# Altium schematic sheet TOP_SHEET.SchDoc
size A; SheetNumber: 1; SheetTotal: 9
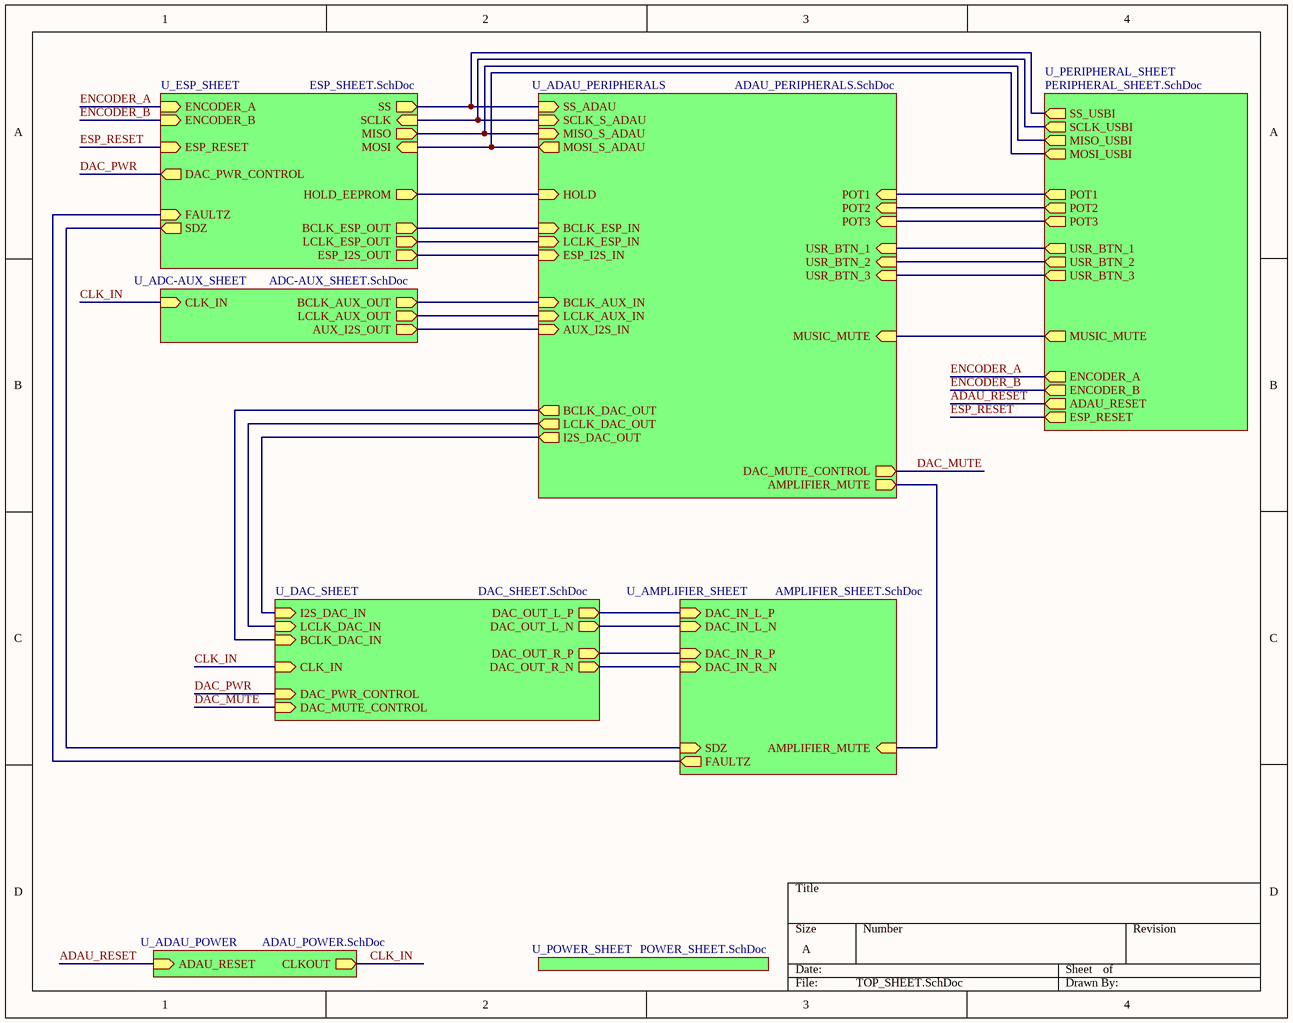
[diagram p0: TOP_SHEET.SchDoc]

## Sub-sheets
U_ADAU_PERIPHERALS = ADAU_PERIPHERALS.SchDoc: BCLK_DAC_OUT (out), LCLK_DAC_OUT (out), I2S_DAC_OUT (out), USR_BTN_3 (in), USR_BTN_2 (in), USR_BTN_1 (in), POT3 (in), POT2 (in), POT1 (in), SS_ADAU (in), SCLK_S_ADAU (in), MISO_S_ADAU (in), MOSI_S_ADAU (out), HOLD (in), BCLK_ESP_IN (in), LCLK_ESP_IN (in), ESP_I2S_IN (in), LCLK_AUX_IN (in), BCLK_AUX_IN (in), AUX_I2S_IN (in), AMPLIFIER_MUTE (out), DAC_MUTE_CONTROL (out), MUSIC_MUTE (in)
U_ADAU_POWER = ADAU_POWER.SchDoc: ADAU_RESET (in), CLKOUT (out)
U_ADC-AUX_SHEET = ADC-AUX_SHEET.SchDoc: BCLK_AUX_OUT (out), LCLK_AUX_OUT (out), AUX_I2S_OUT (out), CLK_IN (in)
U_AMPLIFIER_SHEET = AMPLIFIER_SHEET.SchDoc: DAC_IN_R_P (in), DAC_IN_R_N (in), DAC_IN_L_P (in), DAC_IN_L_N (in), SDZ (in), AMPLIFIER_MUTE (in), FAULTZ (out)
U_DAC_SHEET = DAC_SHEET.SchDoc: DAC_OUT_L_P (out), DAC_OUT_L_N (out), DAC_PWR_CONTROL (in), DAC_MUTE_CONTROL (in), CLK_IN (in), I2S_DAC_IN (in), BCLK_DAC_IN (in), LCLK_DAC_IN (in), DAC_OUT_R_N (out), DAC_OUT_R_P (out)
U_ESP_SHEET = ESP_SHEET.SchDoc: ENCODER_A (in), ENCODER_B (in), FAULTZ (in), SDZ (out), DAC_PWR_CONTROL (out), ESP_RESET (in), SS (out), SCLK (in), MISO (out), MOSI (in), ESP_I2S_OUT (out), LCLK_ESP_OUT (out), BCLK_ESP_OUT (out), HOLD_EEPROM (out)
U_PERIPHERAL_SHEET = PERIPHERAL_SHEET.SchDoc: USR_BTN_3 (out), USR_BTN_2 (out), USR_BTN_1 (out), POT3 (out), POT2 (out), POT1 (out), SS_USBI (out), SCLK_USBI (out), MISO_USBI (out), MOSI_USBI (out), ESP_RESET (out), ADAU_RESET (out), ENCODER_B (out), ENCODER_A (out), MUSIC_MUTE (out)
U_POWER_SHEET = POWER_SHEET.SchDoc: no entries

## Nets
ADAU_RESET: sheet U_ADAU_POWER/ADAU_RESET, sheet U_PERIPHERAL_SHEET/ADAU_RESET
CLK_IN: sheet U_ADAU_POWER/CLKOUT, sheet U_ADC-AUX_SHEET/CLK_IN, sheet U_DAC_SHEET/CLK_IN
DAC_MUTE: sheet U_ADAU_PERIPHERALS/DAC_MUTE_CONTROL, sheet U_DAC_SHEET/DAC_MUTE_CONTROL
DAC_PWR: sheet U_ESP_SHEET/DAC_PWR_CONTROL, sheet U_DAC_SHEET/DAC_PWR_CONTROL
ENCODER_A: sheet U_ESP_SHEET/ENCODER_A, sheet U_PERIPHERAL_SHEET/ENCODER_A
ENCODER_B: sheet U_ESP_SHEET/ENCODER_B, sheet U_PERIPHERAL_SHEET/ENCODER_B
ESP_RESET: sheet U_ESP_SHEET/ESP_RESET, sheet U_PERIPHERAL_SHEET/ESP_RESET
(unnamed): sheet U_ESP_SHEET/FAULTZ, sheet U_AMPLIFIER_SHEET/FAULTZ
(unnamed): sheet U_ESP_SHEET/SDZ, sheet U_AMPLIFIER_SHEET/SDZ
(unnamed): sheet U_ESP_SHEET/SS, sheet U_ADAU_PERIPHERALS/SS_ADAU, sheet U_PERIPHERAL_SHEET/SS_USBI
(unnamed): sheet U_ESP_SHEET/SCLK, sheet U_ADAU_PERIPHERALS/SCLK_S_ADAU, sheet U_PERIPHERAL_SHEET/SCLK_USBI
(unnamed): sheet U_ESP_SHEET/MISO, sheet U_ADAU_PERIPHERALS/MISO_S_ADAU, sheet U_PERIPHERAL_SHEET/MISO_USBI
(unnamed): sheet U_ESP_SHEET/MOSI, sheet U_ADAU_PERIPHERALS/MOSI_S_ADAU, sheet U_PERIPHERAL_SHEET/MOSI_USBI
(unnamed): sheet U_ESP_SHEET/ESP_I2S_OUT, sheet U_ADAU_PERIPHERALS/ESP_I2S_IN
(unnamed): sheet U_ESP_SHEET/LCLK_ESP_OUT, sheet U_ADAU_PERIPHERALS/LCLK_ESP_IN
(unnamed): sheet U_ESP_SHEET/BCLK_ESP_OUT, sheet U_ADAU_PERIPHERALS/BCLK_ESP_IN
(unnamed): sheet U_ESP_SHEET/HOLD_EEPROM, sheet U_ADAU_PERIPHERALS/HOLD
(unnamed): sheet U_ADAU_PERIPHERALS/BCLK_DAC_OUT, sheet U_DAC_SHEET/BCLK_DAC_IN
(unnamed): sheet U_ADAU_PERIPHERALS/LCLK_DAC_OUT, sheet U_DAC_SHEET/LCLK_DAC_IN
(unnamed): sheet U_ADAU_PERIPHERALS/I2S_DAC_OUT, sheet U_DAC_SHEET/I2S_DAC_IN
(unnamed): sheet U_ADAU_PERIPHERALS/USR_BTN_3, sheet U_PERIPHERAL_SHEET/USR_BTN_3
(unnamed): sheet U_ADAU_PERIPHERALS/USR_BTN_2, sheet U_PERIPHERAL_SHEET/USR_BTN_2
(unnamed): sheet U_ADAU_PERIPHERALS/USR_BTN_1, sheet U_PERIPHERAL_SHEET/USR_BTN_1
(unnamed): sheet U_ADAU_PERIPHERALS/POT3, sheet U_PERIPHERAL_SHEET/POT3
(unnamed): sheet U_ADAU_PERIPHERALS/POT2, sheet U_PERIPHERAL_SHEET/POT2
(unnamed): sheet U_ADAU_PERIPHERALS/POT1, sheet U_PERIPHERAL_SHEET/POT1
(unnamed): sheet U_ADAU_PERIPHERALS/LCLK_AUX_IN, sheet U_ADC-AUX_SHEET/LCLK_AUX_OUT
(unnamed): sheet U_ADAU_PERIPHERALS/BCLK_AUX_IN, sheet U_ADC-AUX_SHEET/BCLK_AUX_OUT
(unnamed): sheet U_ADAU_PERIPHERALS/AUX_I2S_IN, sheet U_ADC-AUX_SHEET/AUX_I2S_OUT
(unnamed): sheet U_ADAU_PERIPHERALS/AMPLIFIER_MUTE, sheet U_AMPLIFIER_SHEET/AMPLIFIER_MUTE
(unnamed): sheet U_ADAU_PERIPHERALS/MUSIC_MUTE, sheet U_PERIPHERAL_SHEET/MUSIC_MUTE
(unnamed): sheet U_DAC_SHEET/DAC_OUT_L_P, sheet U_AMPLIFIER_SHEET/DAC_IN_L_P
(unnamed): sheet U_DAC_SHEET/DAC_OUT_L_N, sheet U_AMPLIFIER_SHEET/DAC_IN_L_N
(unnamed): sheet U_DAC_SHEET/DAC_OUT_R_N, sheet U_AMPLIFIER_SHEET/DAC_IN_R_N
(unnamed): sheet U_DAC_SHEET/DAC_OUT_R_P, sheet U_AMPLIFIER_SHEET/DAC_IN_R_P